# EasyEDA Pro project ProPrj_TI车_2025-07-04.epro

# Schematic Schematic1
Board Name: Board1; Create Date: 2025-04-24; Page Name: P1; Project Name: TI车; Schematic Name: Schematic1; Update Date: 2025-04-24; Company: 嘉立创EDA; Page Size: A4; Version: V1.0
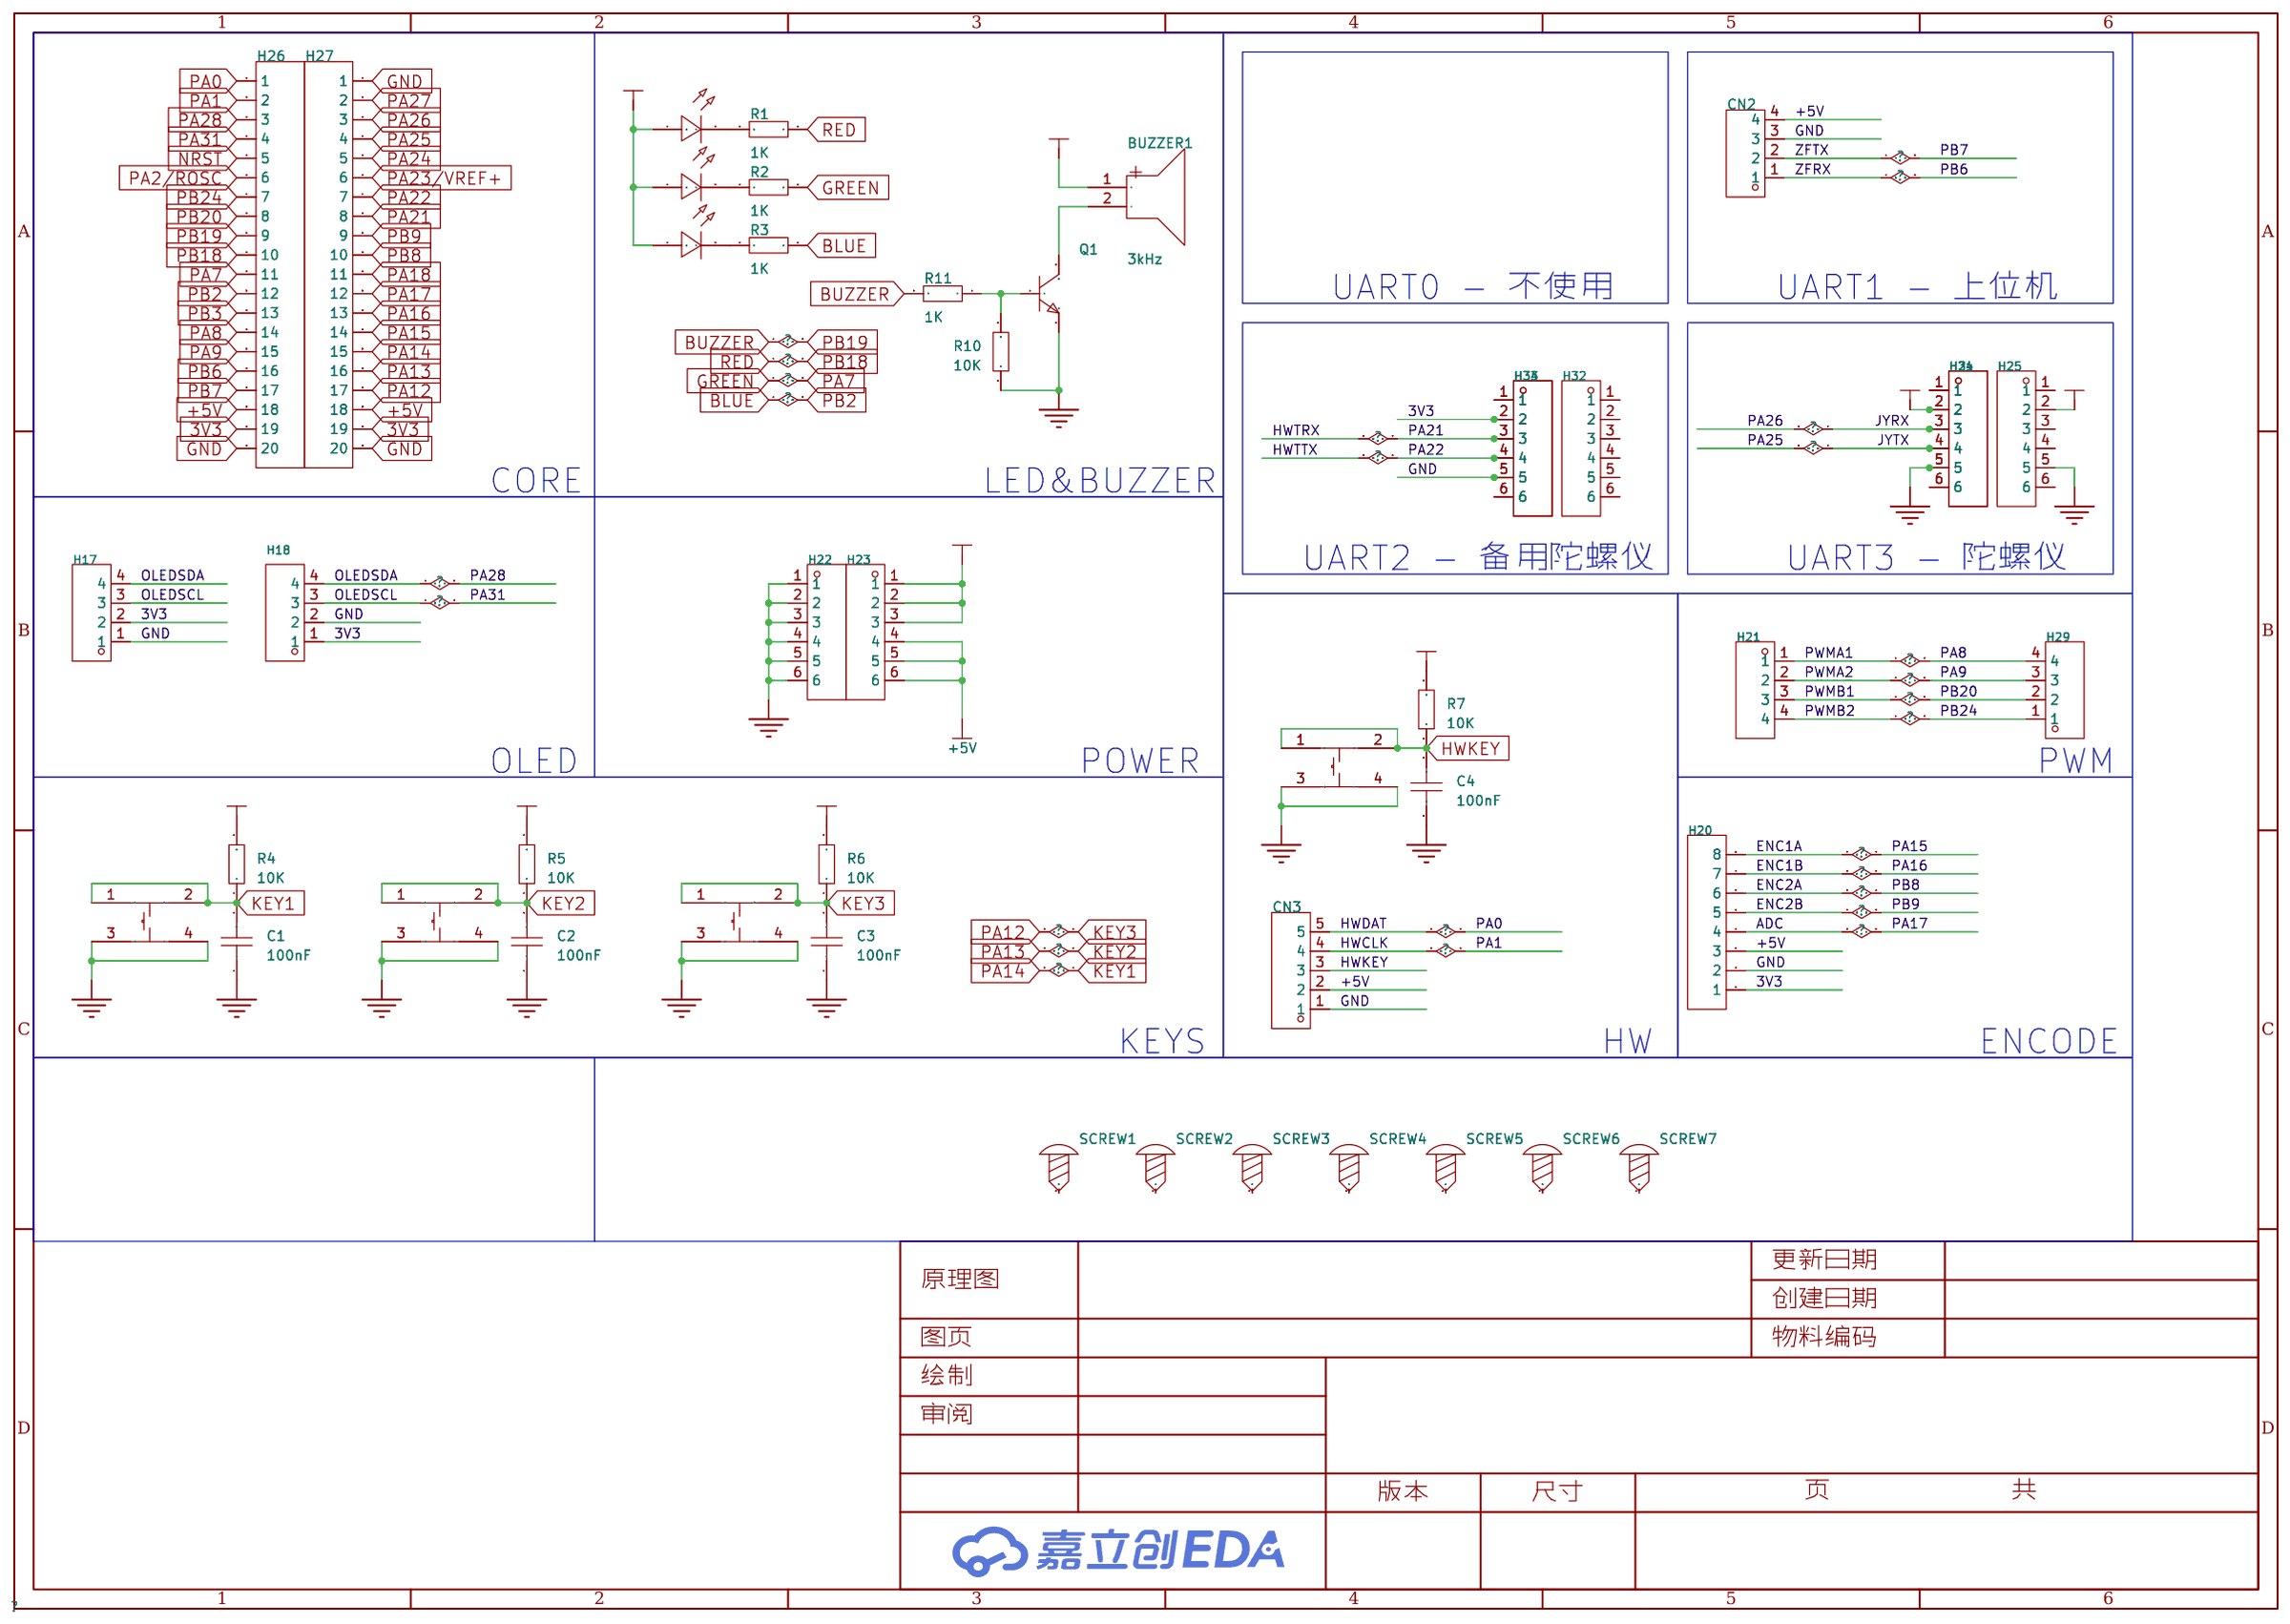
[diagram p0: schematic sheet]

## Parts
BUZZER1  3kHz  [BUZ-TH_BD9.0-P5.00-D0.6-FD]
C1  100nF  [C0805]
C2  100nF  [C0805]
C3  100nF  [C0805]
C4  100nF  [C0805]
CN2  XH-4AW  [CONN-TH_XH-4AW]
CN3  XH-5AW  [CONN-TH_5P-P2.54_XH-5AW_C2908614]
H17  -  [HDR-TH_4P-P2.54-V-F]
H18  -  [HDR-TH_4P-P2.54-V-F]
H20  -  [HDR-TH_8P-P2.54-V-F-1]
H21  -  [HDR-TH_4P-P2.54-V-F]
H22  -  [HDR-TH_6P-P2.54-V-F]
H23  -  [HDR-TH_6P-P2.54-V-F]
H24  -  [HDR-TH_6P-P2.54-V-F]
H25  -  [HDR-TH_6P-P2.54-V-F]
H26  -  [HDR-TH_20P-P2.54-V-F]
H27  -  [HDR-TH_20P-P2.54-V-F]
H29  -  [HDR-TH_4P-P2.54-V-F]
H31  -  [HDR-TH_6P-P2.54-V-F]
H32  -  [HDR-TH_6P-P2.54-V-F]
H33  -  [HDR-TH_6P-P2.54-V-F]
H34  -  [HDR-TH_6P-P2.54-V-F]
LED1  -  [LED_TH-3mm]
LED2  -  [LED_TH-3mm]
LED3  -  [LED_TH-3mm]
Q1  -  [S8050_SOT-23]
R1  1K  [R0805_1]
R2  1K  [R0805_1]
R3  1K  [R0805_1]
R4  10K  [R0805_1]
R5  10K  [R0805_1]
R6  10K  [R0805_1]
R7  10K  [R0805_1]
R10  10K  [R0805_1]
R11  1K  [R0805_1]
SCREW1  -  [M3螺丝]
SCREW2  -  [M3螺丝]
SCREW3  -  [M3螺丝]
SCREW4  -  [M3螺丝]
SCREW5  -  [M3螺丝]
SCREW6  -  [M3螺丝]
SCREW7  -  [M3螺丝]
SW6  TS-1002S-05026C  [KEY-SMD_4P-L6.0-W6.0-P4.50-LS9.0]
SW7  TS-1002S-05026C  [KEY-SMD_4P-L6.0-W6.0-P4.50-LS9.0]
SW8  TS-1002S-05026C  [KEY-SMD_4P-L6.0-W6.0-P4.50-LS9.0]
SW9  TS-1002S-05026C  [KEY-SMD_4P-L6.0-W6.0-P4.50-LS9.0]

## Library data of the parts
BUZZER1 = HNB09A03: 驱动方式:有源(内含驱动线路);构造类型:电磁式;频率:3kHz;声压(SPL):85dB@10cm;; LCSC Part Name: 电磁式有源一体蜂鸣器HNB09A03; Supplier Part: C96102; Manufacturer: 华能; Supplier Footprint: 插件,D=9mm; JLCPCB Part Class: 扩展库; Datasheet: https://atta.szlcsc.com/upload/public/pdf/source/20170522/1495448326172.pdf; Supplier: LCSC; Oscillator Circuit: 有源(内含驱动线路); Technology Type: 电磁式; Operating Voltage: 1.5V~4.5V; Current Consumption: 30mA; Sound Pressure Level (SPL): 85dB@10cm; Diameter (φD): 9mm; Height: 5.5mm; Operating Temperature: -20℃~+70℃
C1-C4 = CAP_0603: Supplier Footprint: 0603
CN2 = XH-4AW: 插针结构:1x4P;间距:2.54mm;安装方式:弯插;参考系列:XH;总PIN数:4P;排数:1;每排PIN数:4;行距:-;额定电流:3A;触头材质:黄铜;触头镀层:锡;工作温度范围:-25℃~+85℃;; LCSC Part Name: 1x4P 间距:2.54mm 弯插 系列:XH; Supplier Part: C2908613; Manufacturer: HCTL(华灿天禄); Supplier Footprint: 弯插,P=2.5mm; JLCPCB Part Class: 扩展库; Datasheet: https://atta.szlcsc.com/upload/public/pdf/source/20230711/B565BAF3B11666EF6B81B3605408F2BD.pdf; Supplier: LCSC; Pins Structure: 1x4P; Pitch: 2.54mm; Mounting Style: 弯插; Reference Series: XH; Number of Pins: 4P; Number of Rows: 1; Number of PINs Per Row: 4; Current Rating (Max): 3A; Contact Material: 黄铜; Contact Plating: 锡; Operating Temperature Range: -25℃~+85℃
CN3 = XH-5AW: 插针结构:1x5P;间距:2.54mm;安装方式:弯插;参考系列:XH;总PIN数:5P;排数:1;每排PIN数:5;行距:-;额定电流:3A;触头材质:黄铜;触头镀层:锡;工作温度范围:-25℃~+85℃;; LCSC Part Name: 1x5P 间距:2.54mm 弯插 系列:XH; Supplier Part: C2908614; Manufacturer: HCTL(华灿天禄); Supplier Footprint: 弯插,P=2.5mm; JLCPCB Part Class: 扩展库; Datasheet: https://atta.szlcsc.com/upload/public/pdf/source/20230711/B565BAF3B11666EF6B81B3605408F2BD.pdf; Supplier: LCSC; Pins Structure: 1x5P; Pitch: 2.54mm; Mounting Style: 弯插; Reference Series: XH; Number of Pins: 5P; Number of Rows: 1; Number of PINs Per Row: 5; Current Rating (Max): 3A; Contact Material: 黄铜; Contact Plating: 锡; Operating Temperature Range: -25℃~+85℃
H17 H18 H21 H29 = HDR-F_2.54_1x4P: Supplier Part: C2718488; Supplier Footprint: 插件
H20 = HDR-F_2.54_1x8P: Supplier Part: C27438; Supplier Footprint: 插件
H22-H25 H31-H34 = HDR-F_2.54_1x6P: Supplier Part: C40877; Supplier Footprint: 插件
H26 H27 = HDR-F_2.54_1x20P: Supplier Part: C50984; Supplier Footprint: 插件
LED1 = LED_TH-R_3mm: Supplier Footprint: 插件
LED2 = LED_TH-G_3mm: Supplier Footprint: 插件
LED3 = LED_TH-B_3mm: Supplier Footprint: 插件
Q1 = S8050_SOT_NPN: Supplier Footprint: SOT-23
R1-R7 R10 R11 = Res_0603: Supplier Footprint: 0603
SCREW1-SCREW7 = M3螺丝: Supplier Footprint: 插件
SW6-SW9 = TS-1002S-05026C: 电路结构:单刀单掷;按钮形状:圆形按钮;安装方式:立贴;开关长度:6mm;开关宽度:6mm;开关高度:5mm;触点电流:50mA;额定电压(DC):12V;带灯:-;机械寿命:-;; LCSC Part Name: 6*6*5mm 立贴 轻触开关; Supplier Part: C455110; Manufacturer: XUNPU(讯普); Supplier Footprint: SMD,6x6mm; JLCPCB Part Class: Extended Part; Datasheet: https://atta.szlcsc.com/upload/public/pdf/source/20191118/C455126_F61E8FA1ED640FB1CE0B30B55DEB62E3.pdf; Supplier: LCSC; Circuit: 单刀单掷; Actuator Style: 圆形按钮; Mounting Style: 立贴; Switch Length: 6mm; Switch Width: 6mm; Switch Height: 5mm; Contact Current: 50mA; Voltage Rating (DC): 12V

## Nets
3V3: BUZZER1.1(+) H17.2 H18.1 H20.1 H23.1 H23.2 H23.3 H24.2 H25.2 H26.19 H27.19 H31.2 H33.2 H34.2 LED1.1(C) LED2.1(C) LED3.1(C) R4.2 R5.2 R6.2 R7.2
+5V: CN2.4 CN3.2 H20.3 H23.4 H23.5 H23.6 H26.18 H27.18
GND: C1.1 C2.1 C3.1 C4.1 CN2.3 CN3.1 H17.1 H18.2 H20.2 H22.1 H22.2 H22.3 H22.4 H22.5 H22.6 H24.5 H25.5 H26.20 H27.1 H27.20 H31.5 H33.5 H34.5 Q1.2 R10.1 SW6.3 SW6.4 SW7.3 SW7.4 SW8.3 SW8.4 SW9.3 SW9.4
ADC: H20.4 H27.12
BLUE: H26.12 R3.2
BUZZER: H26.9 R11.2
ENC1A: H20.8 H27.14
ENC1B: H20.7 H27.13
ENC2A: H20.6 H27.10
ENC2B: H20.5 H27.9
GREEN: H26.11 R2.2
HWCLK: CN3.4 H26.2
HWDAT: CN3.5 H26.1
HWKEY: C4.2 CN3.3 R7.1 SW6.1 SW6.2
HWTRX: H27.8 H33.3 H34.3
HWTTX: H27.7 H33.4 H34.4
JYRX: H24.3 H27.3 H31.3
JYTX: H24.4 H27.4 H31.4
KEY1: C1.2 H27.15 R4.1 SW7.1 SW7.2
KEY2: C2.2 H27.16 R5.1 SW8.1 SW8.2
KEY3: C3.2 H27.17 R6.1 SW9.1 SW9.2
NRST: H26.5
OLEDSCL: H17.3 H18.3 H26.4
OLEDSDA: H17.4 H18.4 H26.3
PA2/ROSC: H26.6
PA8: H21.1 H26.14 H29.4
PA9: H21.2 H26.15 H29.3
PA18: H27.11
PA23/VREF+: H27.6
PA24: H27.5
PA27: H27.2
PB3: H26.13
PB6: CN2.1 H26.16
PB7: CN2.2 H26.17
PB18: H26.10 R1.2
PB20: H21.3 H26.8 H29.2
PB24: H21.4 H26.7 H29.1
$1N5442: BUZZER1.2(-) Q1.3
$1N5513: Q1.1 R10.2 R11.1
$1N6484: LED1.2(A) R1.1
$1N6509: LED2.2(A) R2.1
$1N6557: LED3.2(A) R3.1
$1N18733: H24.1 H31.1
$1N18735: H24.6 H31.6
$1N19083: H33.1 H34.1
$1N19085: H33.6 H34.6

Not connected (* = marked no-connect by the designer): H25 1 3 4 6; H32 1 2 3 4 5 6; SCREW1 1; SCREW2 1; SCREW3 1; SCREW4 1; SCREW5 1; SCREW6 1; SCREW7 1

## Notes on the sheet
- UART0 - 不使用
- UART1 - 上位机
- CORE
- LED&BUZZER
- UART2 - 备用陀螺仪
- UART3 - 陀螺仪
- OLED
- POWER
- PWM
- KEYS
- HW
- ENCODE

# Board PCB1
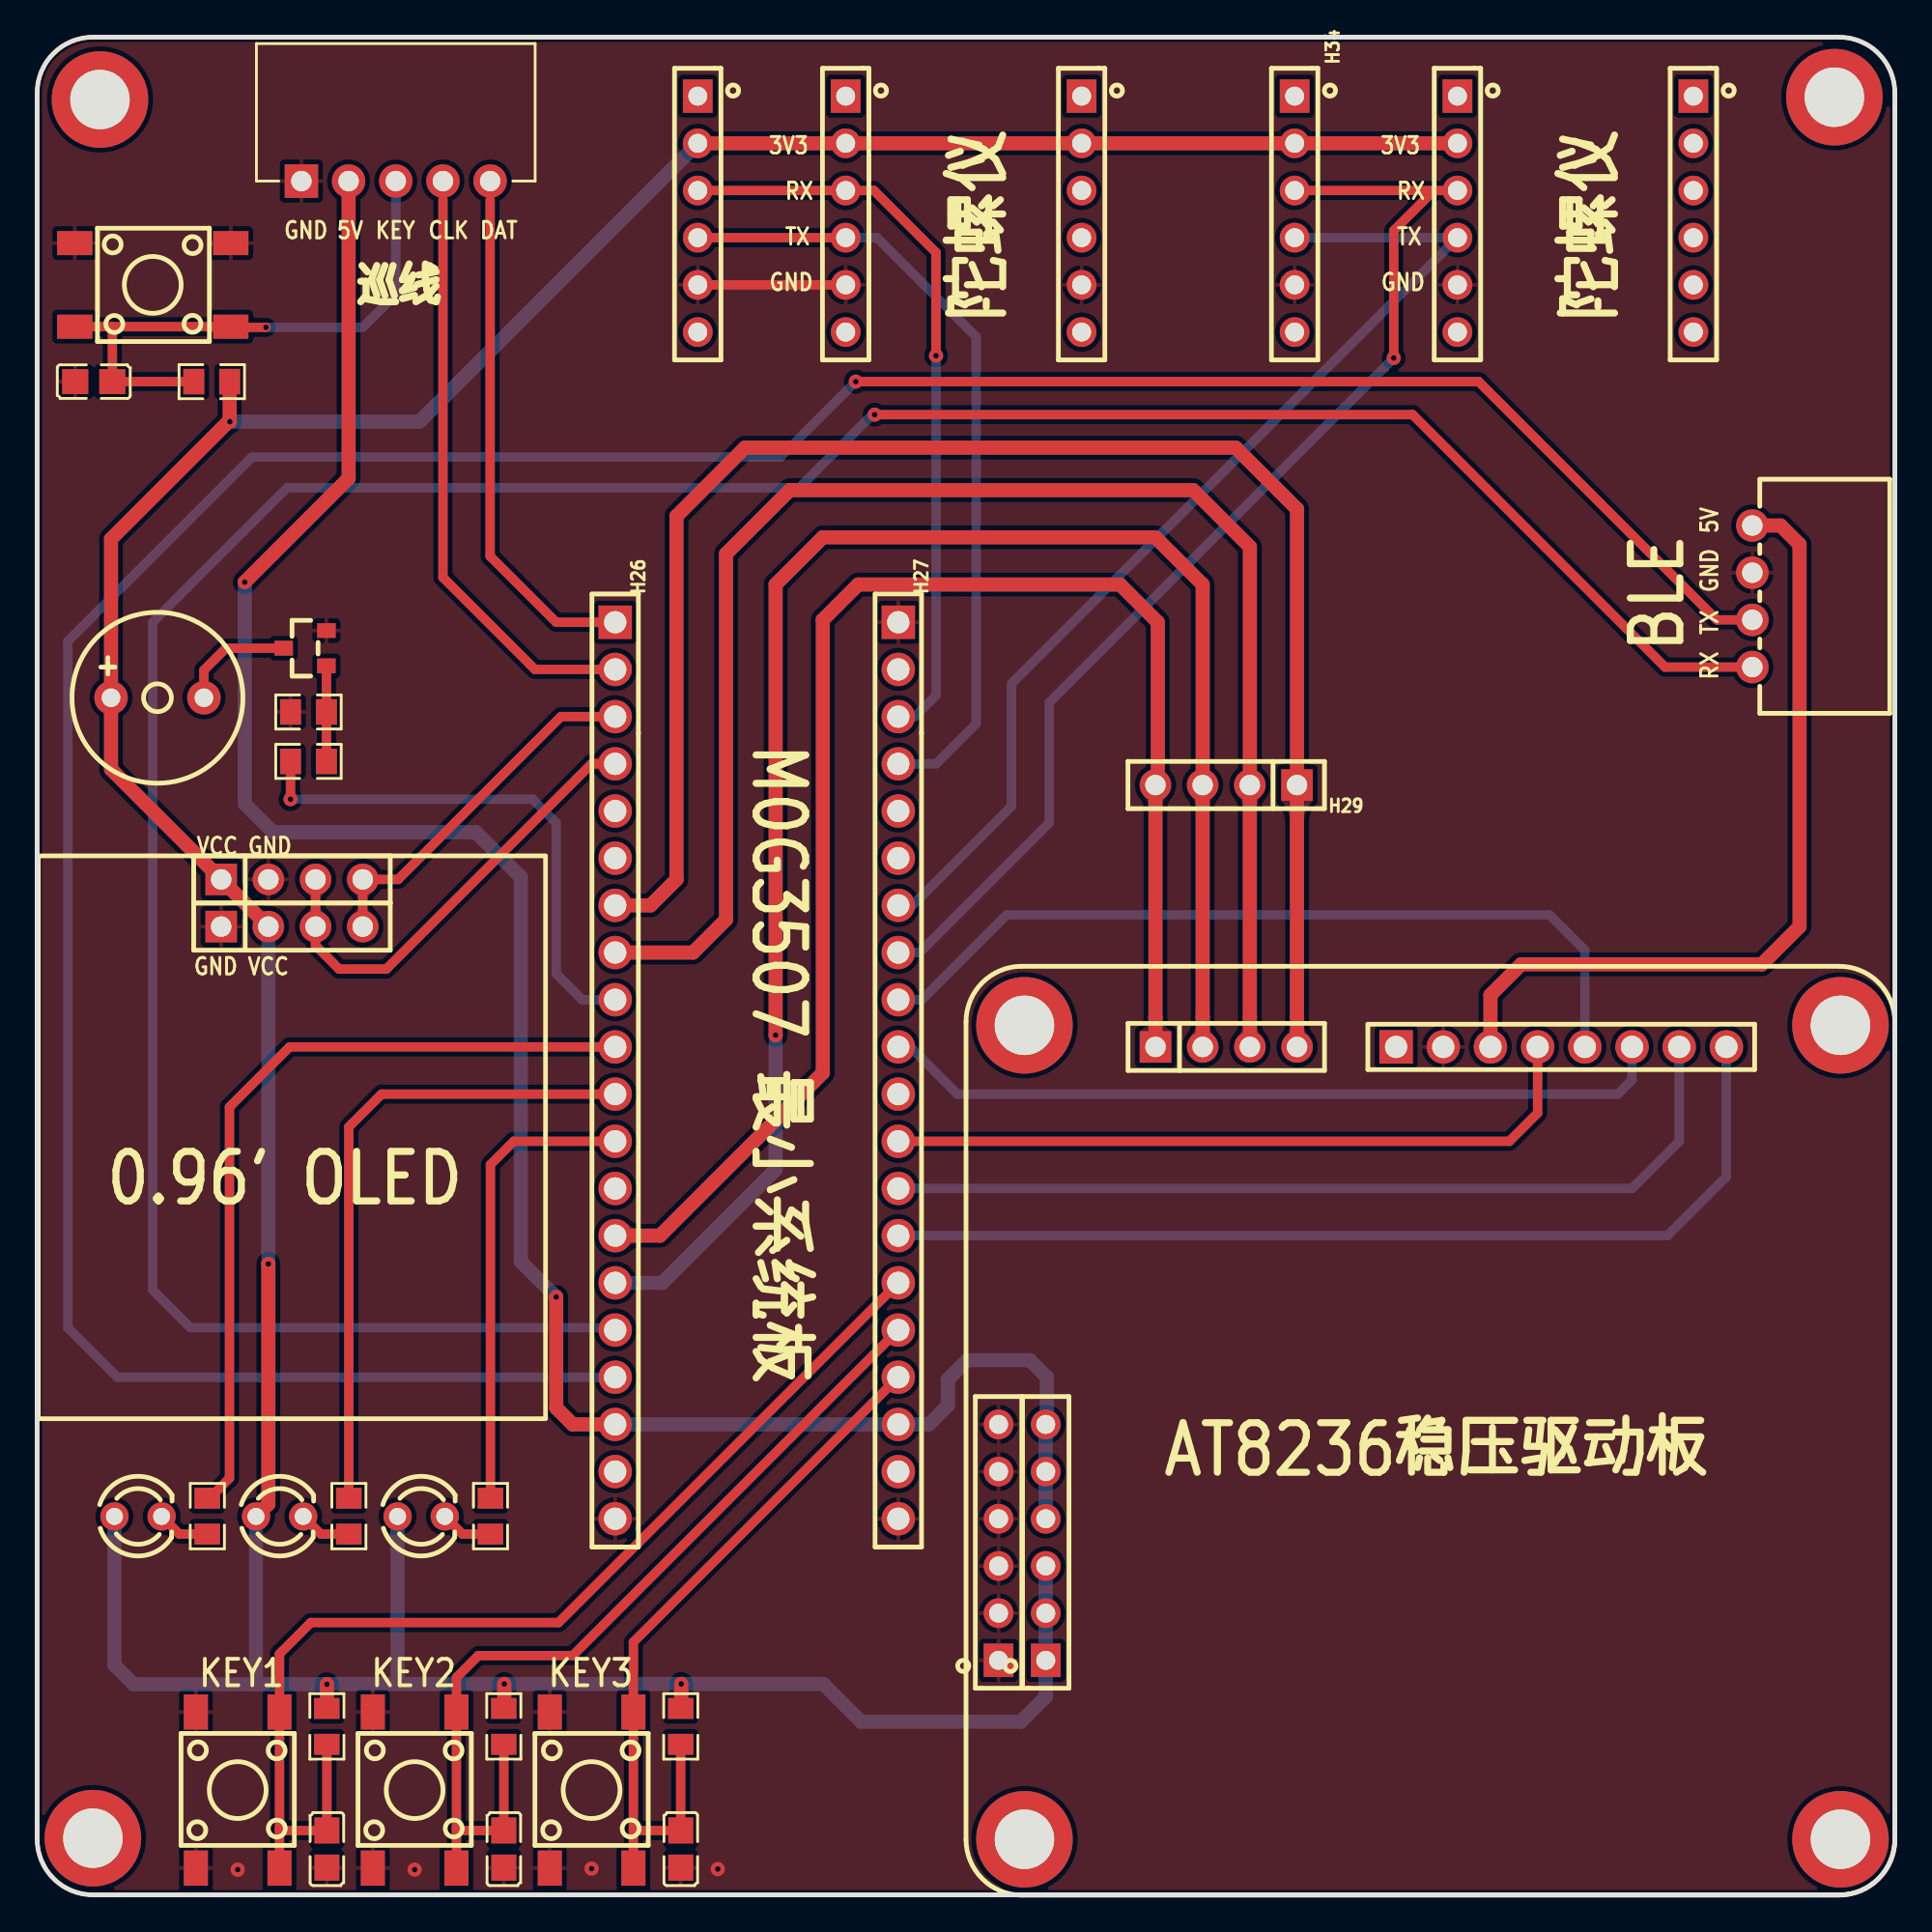
[diagram p1: board, top side]
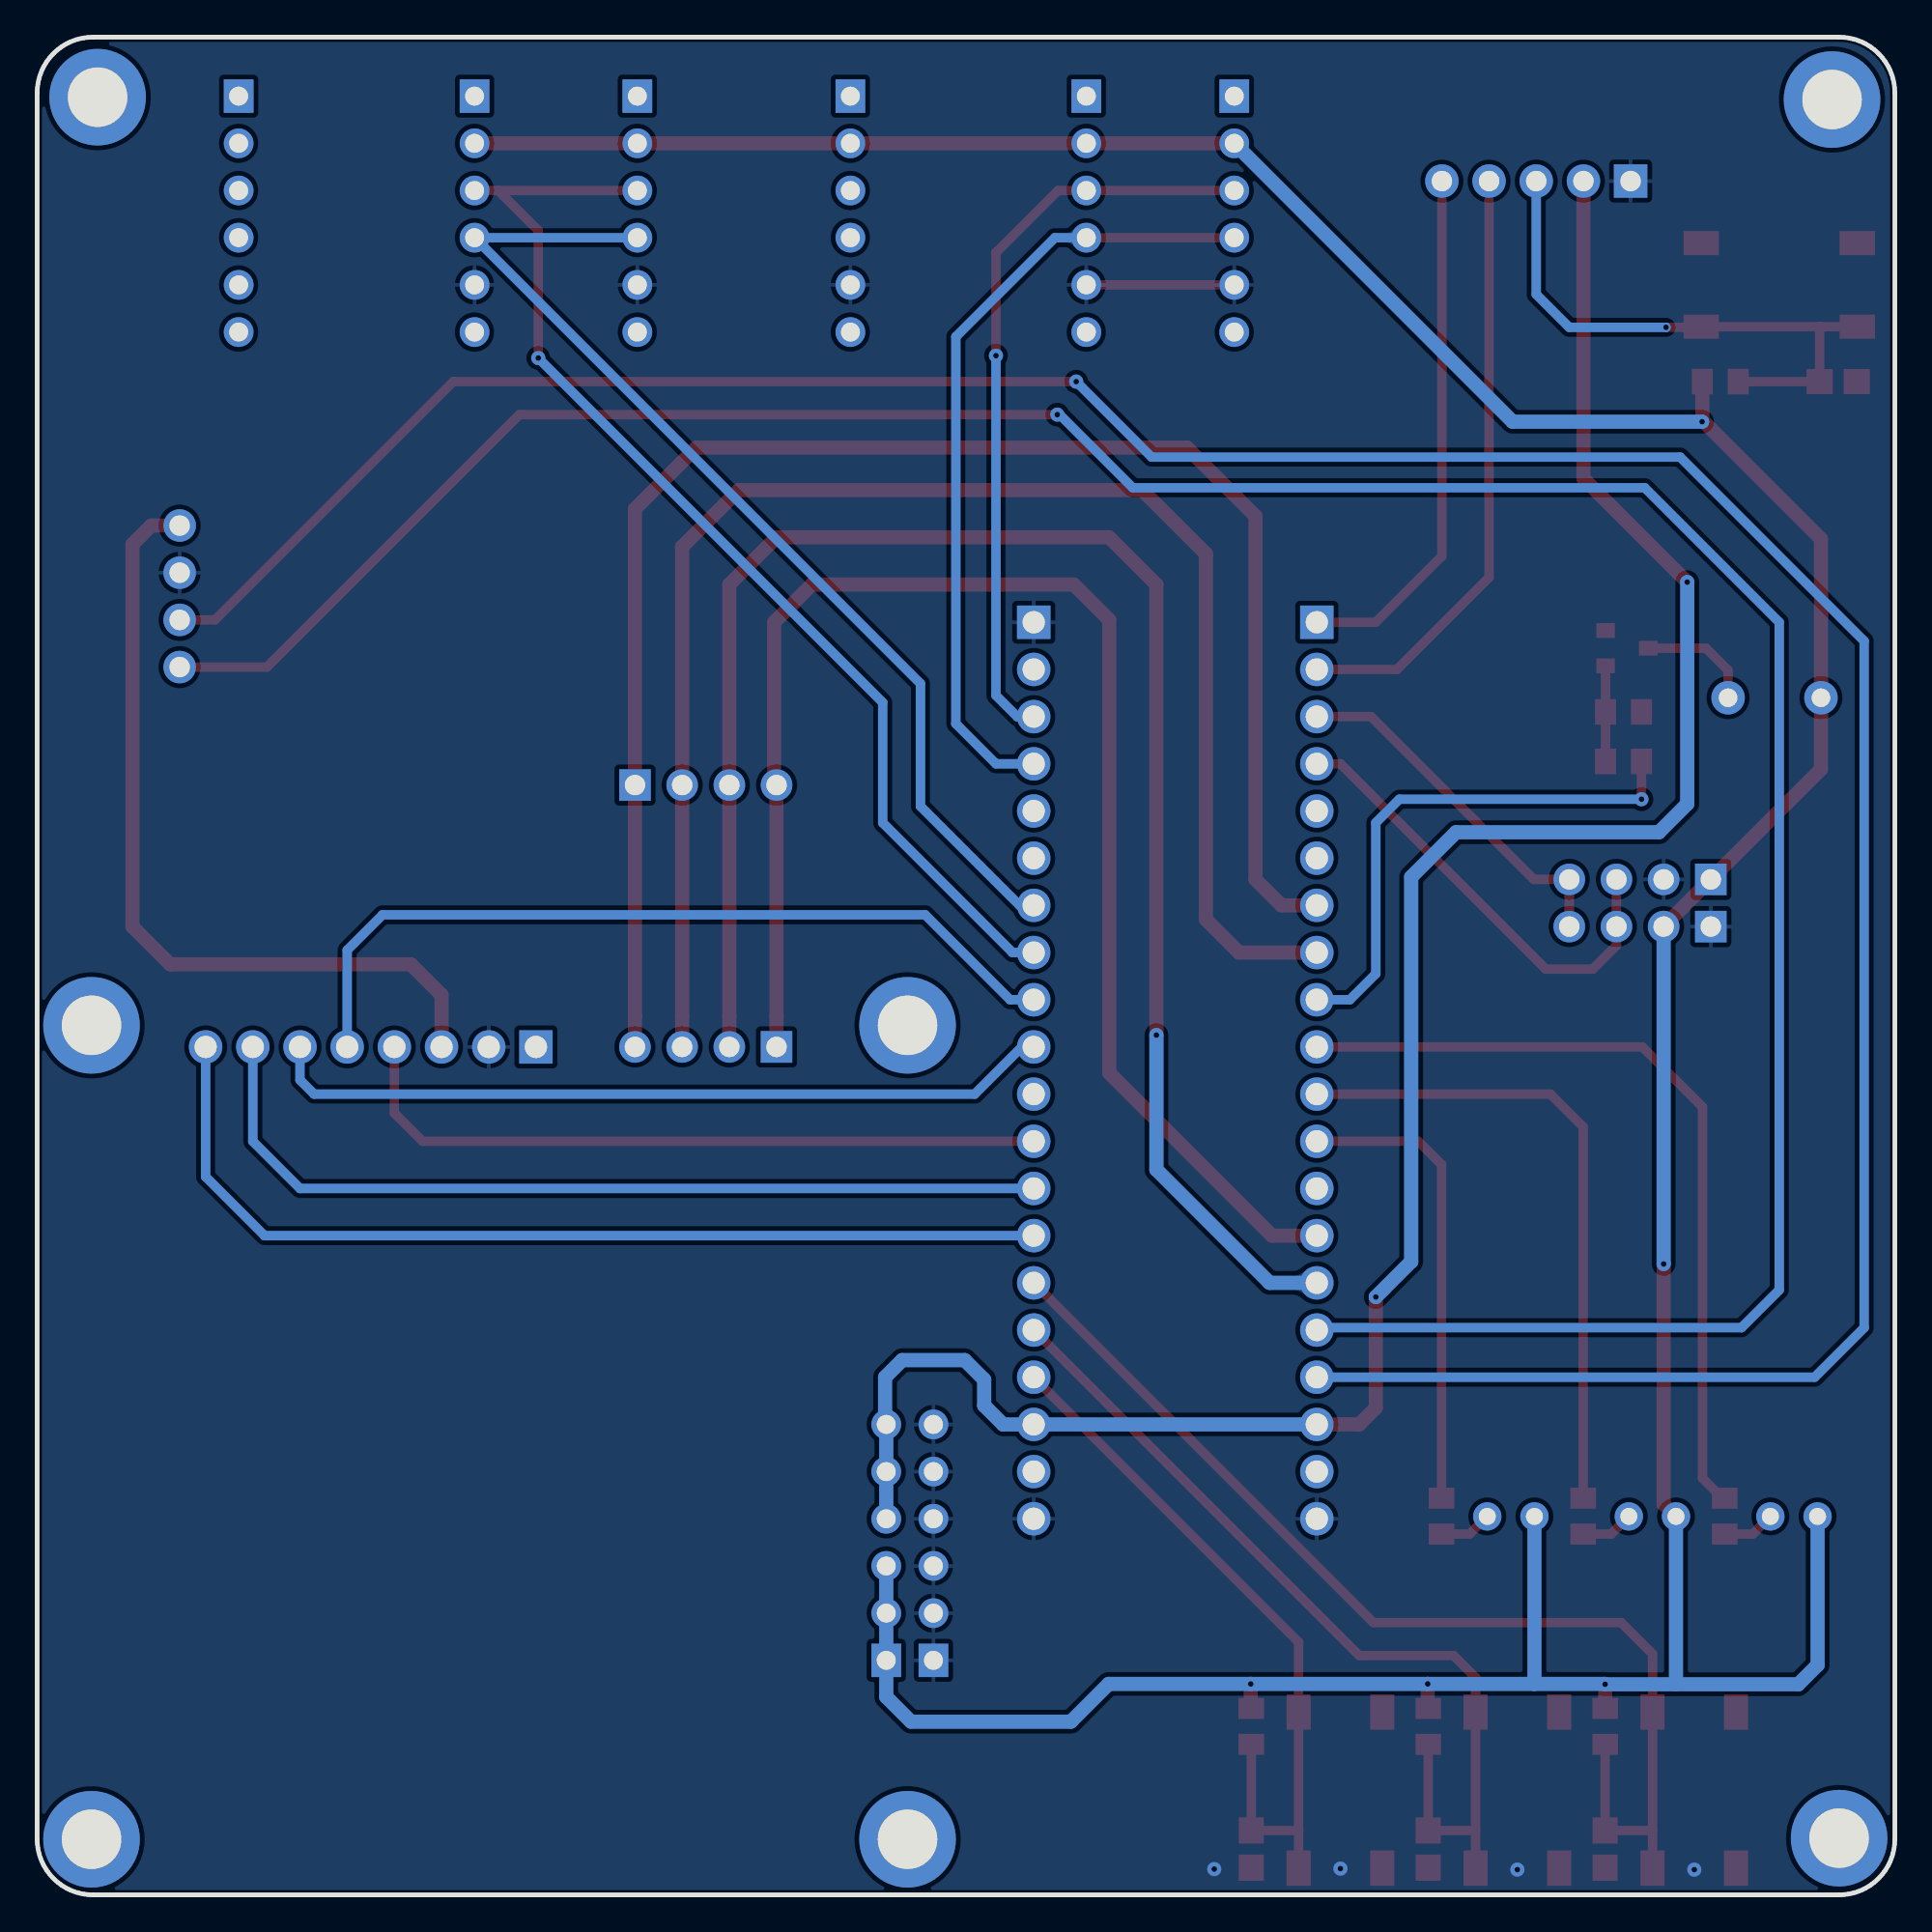
[diagram p2: board, bottom side, seen from below]

Outline 100 x 100 mm; copper layers: Top Layer, Bottom Layer. Coordinates in mm from the lower left corner of the outline.
Outline path: 0,97 0,3 arc(0.88,0.88) 3,0 97,0 arc(99.12,0.88) 100,3 100,97 arc(99.12,99.12) 97,100 3,100 arc(0.88,99.12) 0,97
Stack: Top Layer 0.035mm / Dielectric1 1.51mm FR4 er 4.5 / Bottom Layer 0.035mm

## Design rules (mm)
template: JLCPCB Capability(Two Layers Board)
spacing copperThickness1oz (default): track to track 0.102, other pairs 0.152 to 0.3
spacing copperThickness2oz: track to track 0.203, other pairs 0.152 to 0.3
track width copperThickness1oz (default): min 0.127, default 0.254, max 2.54
track width copperThickness2oz: min 0.203, default 0.254, max 2.54
differential pair differentialPair (default): width min 0.127, default 0.254, max 2.54; gap min 0.152, default 0.152
via viaSize (default): diameter min 0.5, default 0.61, max 10; hole min 0.3, default 0.305, max 6.3

## Placement (name value [footprint] x y rotation side)
BUZZER1  3kHz  [BUZ-TH_BD9.0-P5.00-D0.6-FD]  6.48 64.44 0 top
C1  100nF  [C0805]  15.6 2.46 90 top
C2  100nF  [C0805]  25.12 2.46 90 top
C3  100nF  [C0805]  34.65 2.46 90 top
C4  100nF  [C0805]  3.05 81.46 0 top
CN2  XH-4AW  [CONN-TH_XH-4AW]  92.33 69.9 90 top
CN3  XH-5AW  [CONN-TH_5P-P2.54_XH-5AW_C2908614]  19.3 92.25 0 top
H17  -  [HDR-TH_4P-P2.54-V-F]  13.72 52.12 0 top
H18  -  [HDR-TH_4P-P2.54-V-F]  13.72 54.66 0 top
H20  -  [HDR-TH_8P-P2.54-V-F-1]  82.04 45.64 0 top
H21  -  [HDR-TH_4P-P2.54-V-F]  64.01 45.64 0 top
H22  -  [HDR-TH_6P-P2.54-V-F]  51.75 18.97 90 top
H23  -  [HDR-TH_6P-P2.54-V-F]  54.29 18.97 90 top
H24  -  [HDR-TH_6P-P2.54-V-F]  43.52 90.47 270 top
H25  -  [HDR-TH_6P-P2.54-V-F]  56.22 90.47 270 top
H26  -  [HDR-TH_20P-P2.54-V-F]  31.12 44.37 270 top
H27  -  [HDR-TH_20P-P2.54-V-F]  46.35 44.37 270 top
H29  -  [HDR-TH_4P-P2.54-V-F]  64.01 59.74 180 top
H31  -  [HDR-TH_6P-P2.54-V-F]  35.56 90.47 270 top
H32  -  [HDR-TH_6P-P2.54-V-F]  89.15 90.47 270 top
H33  -  [HDR-TH_6P-P2.54-V-F]  76.45 90.47 270 top
H34  -  [HDR-TH_6P-P2.54-V-F]  67.69 90.47 270 top
LED1  -  [LED_TH-3mm]  5.43 20.37 0 top
LED2  -  [LED_TH-3mm]  13.05 20.37 0 top
LED3  -  [LED_TH-3mm]  20.67 20.37 0 top
Q1  -  [S8050_SOT-23]  14.42 66.98 0 top
R1  1K  [R0805_1]  9.16 20.39 90 top
R2  1K  [R0805_1]  16.78 20.39 90 top
R3  1K  [R0805_1]  24.4 20.39 90 top
R4  10K  [R0805_1]  15.59 9.07 90 top
R5  10K  [R0805_1]  25.12 9.07 90 top
R6  10K  [R0805_1]  34.64 9.07 90 top
R7  10K  [R0805_1]  9.4 81.46 0 top
R10  10K  [R0805_1]  14.61 63.68 0 top
R11  1K  [R0805_1]  14.61 61.01 180 top
SCREW1  -  [M3螺丝]  3 3.05 0 top
SCREW2  -  [M3螺丝]  3.38 96.64 0 top
SCREW3  -  [M3螺丝]  97.07 2.99 0 top
SCREW4  -  [M3螺丝]  96.75 96.77 0 top
SCREW5  -  [M3螺丝]  53.15 2.99 0 top
SCREW6  -  [M3螺丝]  97.07 46.81 0 top
SCREW7  -  [M3螺丝]  53.15 46.81 0 top
SW6  TS-1002S-05026C  [KEY-SMD_4P-L6.0-W6.0-P4.50-LS9.0]  6.22 86.66 180 top
SW7  TS-1002S-05026C  [KEY-SMD_4P-L6.0-W6.0-P4.50-LS9.0]  10.8 5.64 270 top
SW8  TS-1002S-05026C  [KEY-SMD_4P-L6.0-W6.0-P4.50-LS9.0]  20.32 5.64 270 top
SW9  TS-1002S-05026C  [KEY-SMD_4P-L6.0-W6.0-P4.50-LS9.0]  29.84 5.64 270 top

## Footprints (pads in the part's own frame, mm; a bottom-side part is the same pattern mirrored in y, then rotated)
BUZ-TH_BD9.0-P5.00-D0.6-FD
  round 1.8 hole 1: 1(-2.5,0) 2(2.5,0)
C0805
  rect 1.41x1.35 smd: 1(-1,0) 2(1,0)
CONN-TH_5P-P2.54_XH-5AW_C2908614
  rect 1.8x1.8 hole 1.1: 1(-5.08,0)
  round 1.8 hole 1.1: 2(-2.54,0) 3(0,0) 4(2.54,0) 5(5.08,0)
CONN-TH_XH-4AW
  round 1.75 hole 1.1: 1(-3.81,0) 2(-1.27,0) 3(1.27,0) 4(3.81,0)
HDR-TH_4P-P2.54-V-F
  rect 1.7x1.7 hole 1.1: 1(-3.81,0)
  round 1.7 hole 1.1: 2(-1.27,0) 3(1.27,0) 4(3.81,0)
HDR-TH_6P-P2.54-V-F
  rect 1.8x1.6 hole 1.02: 1(-6.35,0)
  round 1.6 hole 1.02: 2(-3.81,0) 3(-1.27,0) 4(1.27,0) 5(3.81,0) 6(6.35,0)
HDR-TH_8P-P2.54-V-F-1
  rect 1.8x1.8 hole 1.2: 1(-8.89,0)
  round 1.8 hole 1.2: 2(-6.35,0) 3(-3.81,0) 4(-1.27,0) 5(1.27,0) 6(3.81,0) 7(6.35,0) 8(8.89,0)
HDR-TH_20P-P2.54-V-F
  rect 1.8x1.8 hole 1.2: 1(-24.13,0)
  round 1.8 hole 1.2: 2(-21.59,0) 3(-19.05,0) 4(-16.51,0) 5(-13.97,0) 6(-11.43,0) 7(-8.89,0) 8(-6.35,0) 9(-3.81,0) 10(-1.27,0) 11(1.27,0) 12(3.81,0) 13(6.35,0) 14(8.89,0) 15(11.43,0) 16(13.97,0) 17(16.51,0) 18(19.05,0) 19(21.59,0) 20(24.13,0)
KEY-SMD_4P-L6.0-W6.0-P4.50-LS9.0
  rect 1.9x1.3 smd: 1(-4.2,2.25) 2(4.2,2.25) 3(-4.2,-2.25) 4(4.2,-2.25)
LED_TH-3mm
  round 1.524 hole 0.914: 1(-1.27,0) 2(1.27,0)
M3螺丝
  round 5.2 hole 3.2: 1(0,0)
R0805_1
  rect 1.133x1.377 smd: 1(-0.966,0) 2(0.966,0)
S8050_SOT-23
  rect 1x0.8 smd: 1(1.15,-0.823) 2(1.15,1.077) 3(-1.15,0.127)

## Nets
As in the schematic.

Pads without a net: H25 1 3 4 6; H32 1 2 3 4 5 6; SCREW1 1; SCREW2 1; SCREW3 1; SCREW4 1; SCREW5 1; SCREW6 1; SCREW7 1

## Via types
v1: diameter 0.762, hole 0.305, Top Layer to Bottom Layer, 17 vias
v2: diameter 0.508, hole 0.305, Top Layer to Bottom Layer, 1 via

## Routing (per net, layer and track width the routed paths; a pad name or vN(x,y) marks a point on that pad's centre or on a via; arc(x,y) is an arc through that point)
3V3: length 228.8
  Top Layer w0.762: H33.2 H25.2 H24.2 H31.2 ; v1(34.67,11.35) 34.67,10.06 R6.2 ; R4.2 15.6,10.04 v1(15.6,11.34) ; v1(25.15,11.35) 25.15,10.06 R5.2 ; R7.2 10.36,79.38 3.98,72.99 BUZZER1.1 3.98,60.59 H18.1 H17.2 ; v1(12.45,33.96) 12.45,21.04 LED2.1
  Bottom Layer w0.762: LED2.1 11.78,11.35 11.77,11.34 ; H17.2 v1(12.45,33.96) ; 19.41,11.35 v1(25.15,11.35) v1(34.67,11.35) 42.32,11.35 44.35,9.32 52.96,9.32 54.29,10.66 H23.1 H23.2 54.29,17.7 ; 19.41,11.35 19.4,11.36 LED3.1 ; 19.41,11.35 15.61,11.35 v1(15.6,11.34) 11.77,11.34 ; H31.2 20.57,79.3 v1(10.38,79.3) ; 11.77,11.34 5.19,11.34 4.16,12.37 LED1.1
+5V: length 163.3
  Top Layer w0.762: H20.3 78.23,48.44 79.88,50.09 92.84,50.09 94.87,52.12 94.87,72.69 93.85,73.71 CN2.4 ; CN3.2 16.76,76.25 v1(11.18,70.66) ; v1(27.94,32.18) 27.94,26.21 28.83,25.32 H26.18
  Bottom Layer w0.762: v1(11.18,70.66) 11.18,58.72 12.7,57.2 23.62,57.2 26.03,54.79 26.03,34.09 v1(27.94,32.18) ; H26.18 H27.18 48.01,25.32 49.02,26.34 49.02,27.74 50.07,28.78 53.44,28.78 54.36,27.86 54.36,25.39 H23.6 H23.5 H23.4
GND: length 8
  Top Layer w0.508: H24.5 H31.5
  vias: v1(10.8,1.36) v1(20.32,1.36) v1(29.84,1.41) v1(36.64,1.39)
ADC: length 38.6
  Top Layer w0.508: H20.4 80.77,42.09 79.25,40.56 H27.12
BLUE: length 25.2
  Top Layer w0.508: R3.2 24.4,39.31 25.65,40.56 H26.12
BUZZER: length 28.7
  Top Layer w0.508: R11.2 v1(13.64,58.98)
  Bottom Layer w0.508: v1(13.64,58.98) 26.67,58.98 27.94,57.71 27.94,49.58 29.34,48.18 H26.9
ENC1A: length 52.9
  Bottom Layer w0.508: H20.8 90.93,38.66 87.76,35.48 H27.14
ENC1B: length 48.2
  Bottom Layer w0.508: H27.13 85.85,38.02 88.39,40.56 H20.7
ENC2A: length 42.6
  Bottom Layer w0.508: H27.10 46.99,45.64 49.53,43.1 85.09,43.1 85.85,43.87 H20.6
ENC2B: length 44.8
  Bottom Layer w0.508: H20.5 83.31,50.85 81.41,52.76 52.2,52.76 47.62,48.18 H27.9
GREEN: length 35.1
  Top Layer w0.508: H26.11 18.54,43.1 16.78,41.34 R2.2
HWCLK: length 31.6
  Top Layer w0.508: 21.84,91.24 21.84,70.92 26.8,65.96 H26.2
HWDAT: length 27.4
  Top Layer w0.508: H26.1 27.94,68.5 24.38,72.06 24.38,91.24
HWKEY: length 31.5
  Top Layer w0.508: 4.05,84.41 4.05,84.41 C4.2 R7.1 ; 4.05,84.41 SW6.2 ; 4.05,84.41 SW6.1 10.46,84.38 v2(12.32,84.38)
  Bottom Layer w0.508: v2(12.32,84.38) 17.53,84.38 19.3,86.16 CN3.3
HWTRX: length 62.4
  Top Layer w0.508: v1(73.03,82.73) 73.03,89.59 75.18,91.74 ; 75.18,91.74 H33.3 ; 75.18,91.74 H34.3
  Bottom Layer w0.508: v1(73.03,82.73) 54.48,64.19 54.48,57.71 47.5,50.72 46.35,50.72
HWTTX: length 57.6
  Bottom Layer w0.508: H34.4 H33.4 52.45,65.2 52.45,58.6 47.12,53.26 H27.7
JYRX: length 40.6
  Top Layer w0.508: H31.3 H24.3 45.05,91.74 48.39,88.41 v1(48.39,82.86)
  Bottom Layer w0.508: v1(48.39,82.86) 48.39,64.57 47.24,63.42 H27.3
JYTX: length 43.1
  Top Layer w0.508: H31.4 H24.4
  Bottom Layer w0.508: H27.4 48.39,60.88 50.55,63.04 50.55,83.87 45.21,89.2 H24.4
KEY1: length 60.3
  Top Layer w0.508: 13.05,3.49 SW7.2 ; 13.05,3.49 SW7.1 13.05,12.97 14.73,14.66 28.07,14.66 46.35,32.94 ; 13.05,3.49 13.07,3.46 C1.2 15.6,8.1 R4.1
KEY2: length 49
  Top Layer w0.508: 22.57,3.54 SW8.2 ; 22.57,3.54 SW8.1 22.57,11.7 23.75,12.88 28.83,12.88 H27.16 ; 22.57,3.54 22.64,3.46 C2.2 25.12,8.1 R5.1
KEY3: length 39.5
  Top Layer w0.508: 32.09,3.49 32.12,3.46 C3.2 34.64,3.47 R6.1 ; 32.09,3.49 SW9.1 32.09,13.6 H27.17 ; 32.09,3.49 SW9.2
OLEDSCL: length 24.8
  Top Layer w0.508: H26.4 29.84,60.88 18.8,49.83 16.26,49.83 14.99,51.11 H17.3 H18.3
OLEDSDA: length 19.8
  Top Layer w0.508: H26.3 28.19,63.42 19.43,54.66 H18.4 H17.4
PA8: length 81.8
  Top Layer w0.762: H26.14 33.53,35.48 42.29,44.25 42.29,68.63 44.2,70.54 58.29,70.54 60.32,68.5 60.32,59.87 H29.4 60.2,47.26 60.2,47.26 H21.1
PA9: length 92.6
  Top Layer w0.762: v1(39.75,46.28) 39.75,70.54 42.29,73.08 60.2,73.08 62.74,70.53 62.74,59.74 H29.3 62.74,47.26 62.74,47.26 H21.2
  Bottom Layer w0.762: 31.12,32.94 33.66,32.94 39.75,39.04 v1(39.75,46.28)
PB6: length 158
  Top Layer w0.508: v1(45.09,79.68) 74.04,79.68 87.63,66.09 CN2.1
  Bottom Layer w0.508: 44.96,79.68 41.02,75.74 13.46,75.74 6.22,68.5 6.22,32.56 8.25,30.53 30.99,30.53 H26.16
PB7: length 169.3
  Top Layer w0.508: v1(44.07,81.46) 77.6,81.46 90.42,68.63 CN2.2
  Bottom Layer w0.508: H26.17 4.32,27.86 1.65,30.53 1.65,67.49 11.56,77.39 40,77.39 v1(44.07,81.46)
PB18: length 43.7
  Top Layer w0.508: H26.10 13.59,45.64 10.35,42.41 10.35,22.43 9.28,21.35 R1.2
PB20: length 84.2
  Top Layer w0.762: H21.3 65.28,47.26 65.28,47.26 H29.2 65.28,59.74 65.28,72.56 62.23,75.62 40.51,75.62 37.08,72.19 37.08,52.5 35.31,50.72 31.12,50.72
PB24: length 88.7
  Top Layer w0.762: H26.7 33.02,53.26 34.42,54.66 34.42,74.22 38.1,77.9 64.52,77.9 67.82,74.6 67.82,59.74 H29.1 67.82,47.26 67.82,47.26 H21.4
$1N5442: length 6.3
  Top Layer w0.508: Q1.3 10.16,67.11 8.98,65.92 BUZZER1.2
$1N5513: length 5.1
  Top Layer w0.508: Q1.1 R10.2 R11.1
$1N6484: length 2.8
  Top Layer w0.508: LED1.2 7.65,19.42 R1.1
$1N6509: length 2.8
  Top Layer w0.508: LED2.2 15.27,19.42 R2.1
$1N6557: length 2.9
  Top Layer w0.508: R3.1 22.89,19.42 LED3.2

## Copper pours and planes (outline as drawn; the poured copper is in the pictures)
GND on Top Layer: -13.21,126.29 106.17,126.29 106.17,-19.76 -13.21,-19.76
GND on Bottom Layer: -6.6,109.91 111.63,109.91 111.63,-11.12 -6.6,-11.12

Small or netless copper shapes (teardrops, artwork), in the pictures only: 15 on Top Layer, 2 on Bottom Layer

## Text on the board
Top Silkscreen Layer: GND VCC | VCC GND | GND | 5V | KEY | CLK | DAT | 3V3 | RX | TX | KEY1 | KEY2 | KEY3 | 0.96' OLED | BLE | 巡线 | AT8236稳压驱动板 | M0G3507 最小系统板 | 陀螺仪
